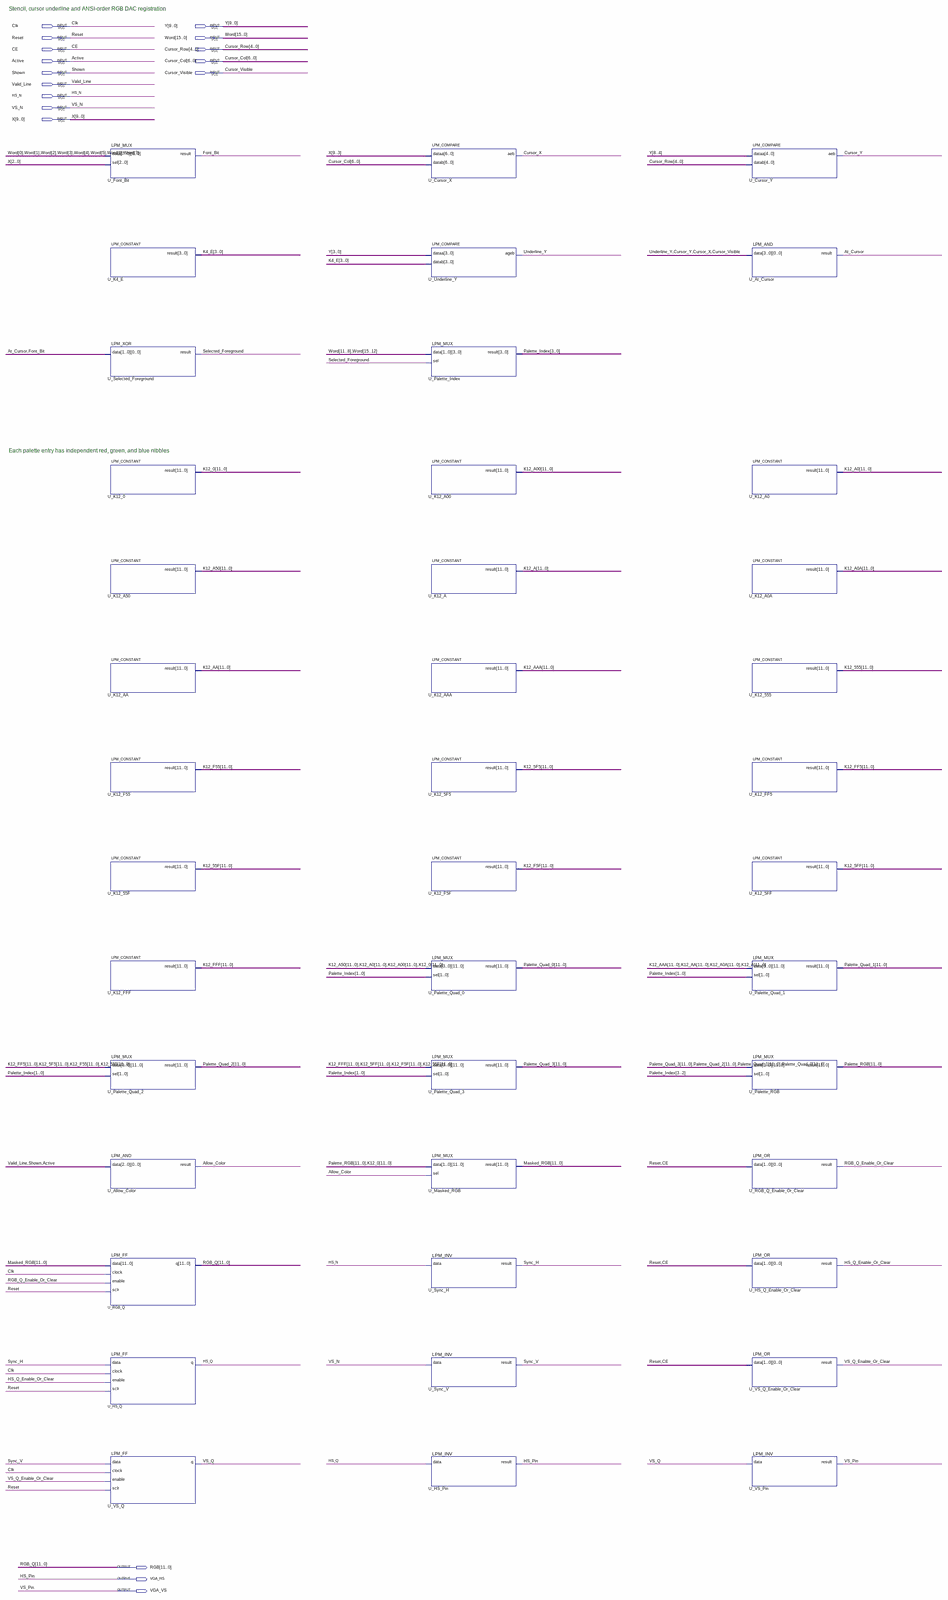
[diagram p0: schematic sheet, whole]
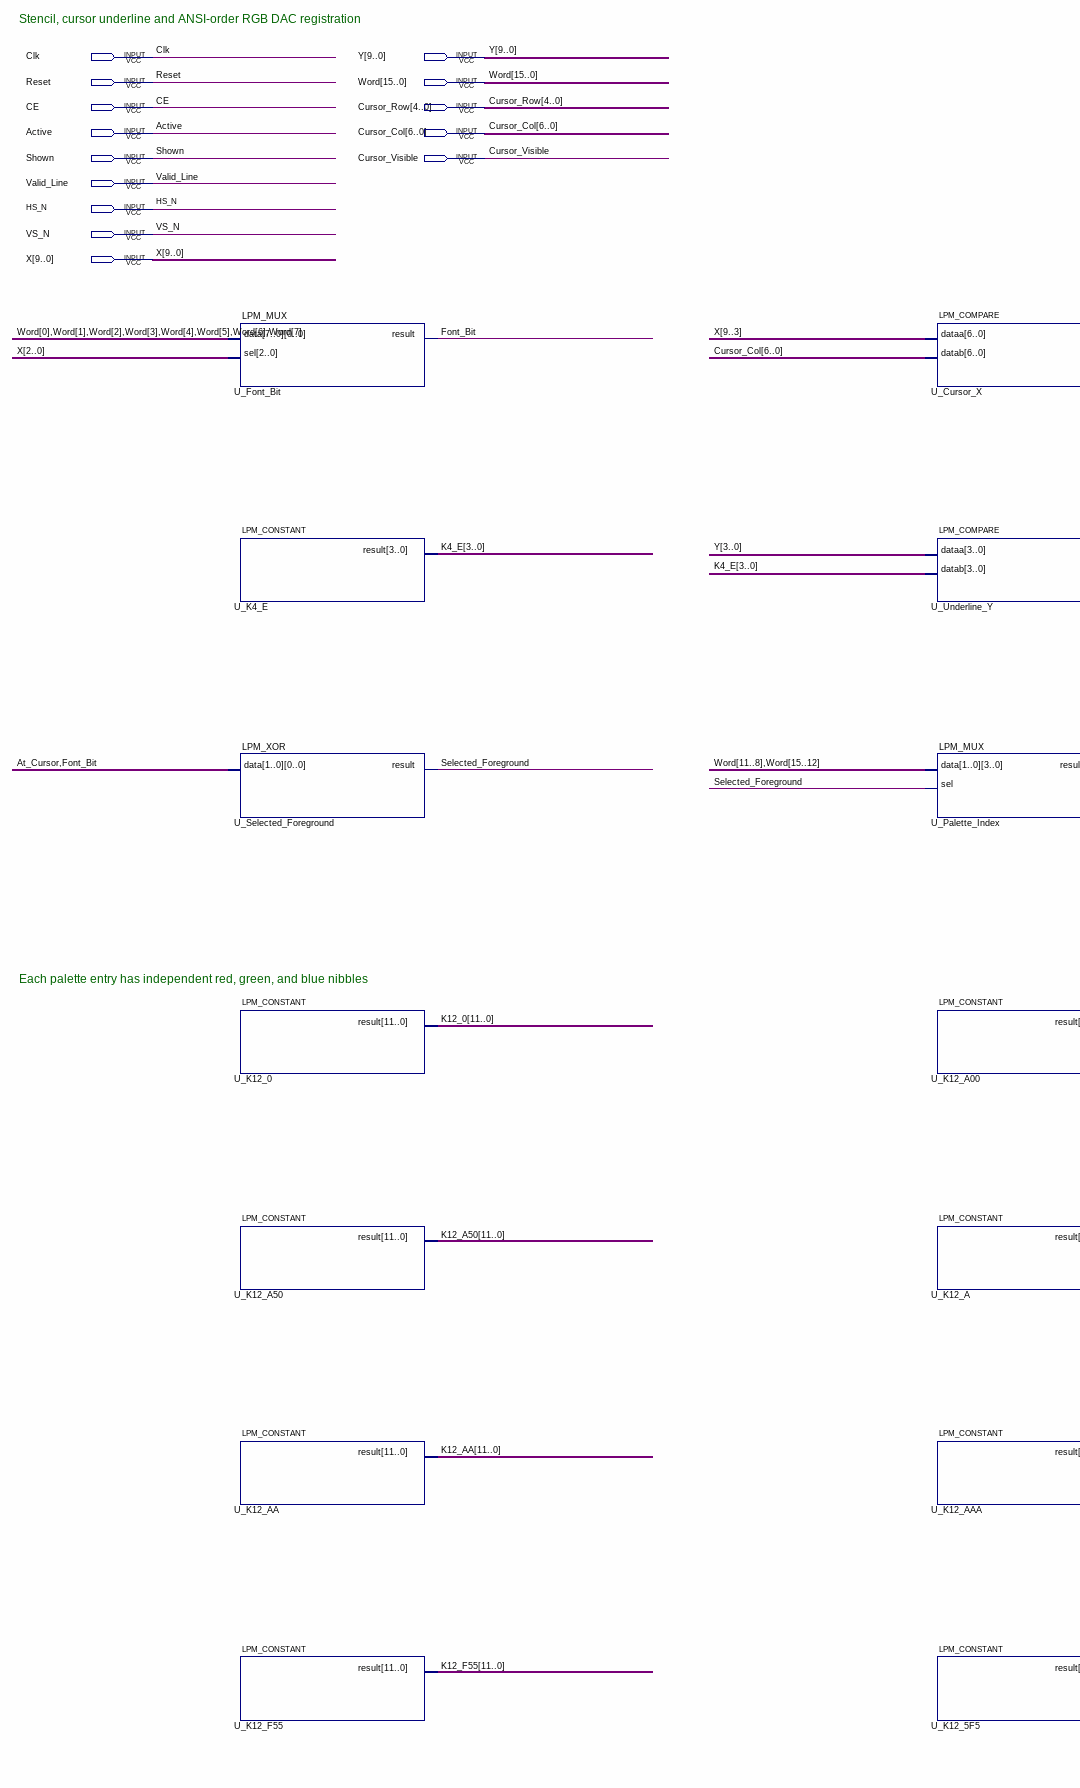
[diagram p1: schematic sheet, upper left part]
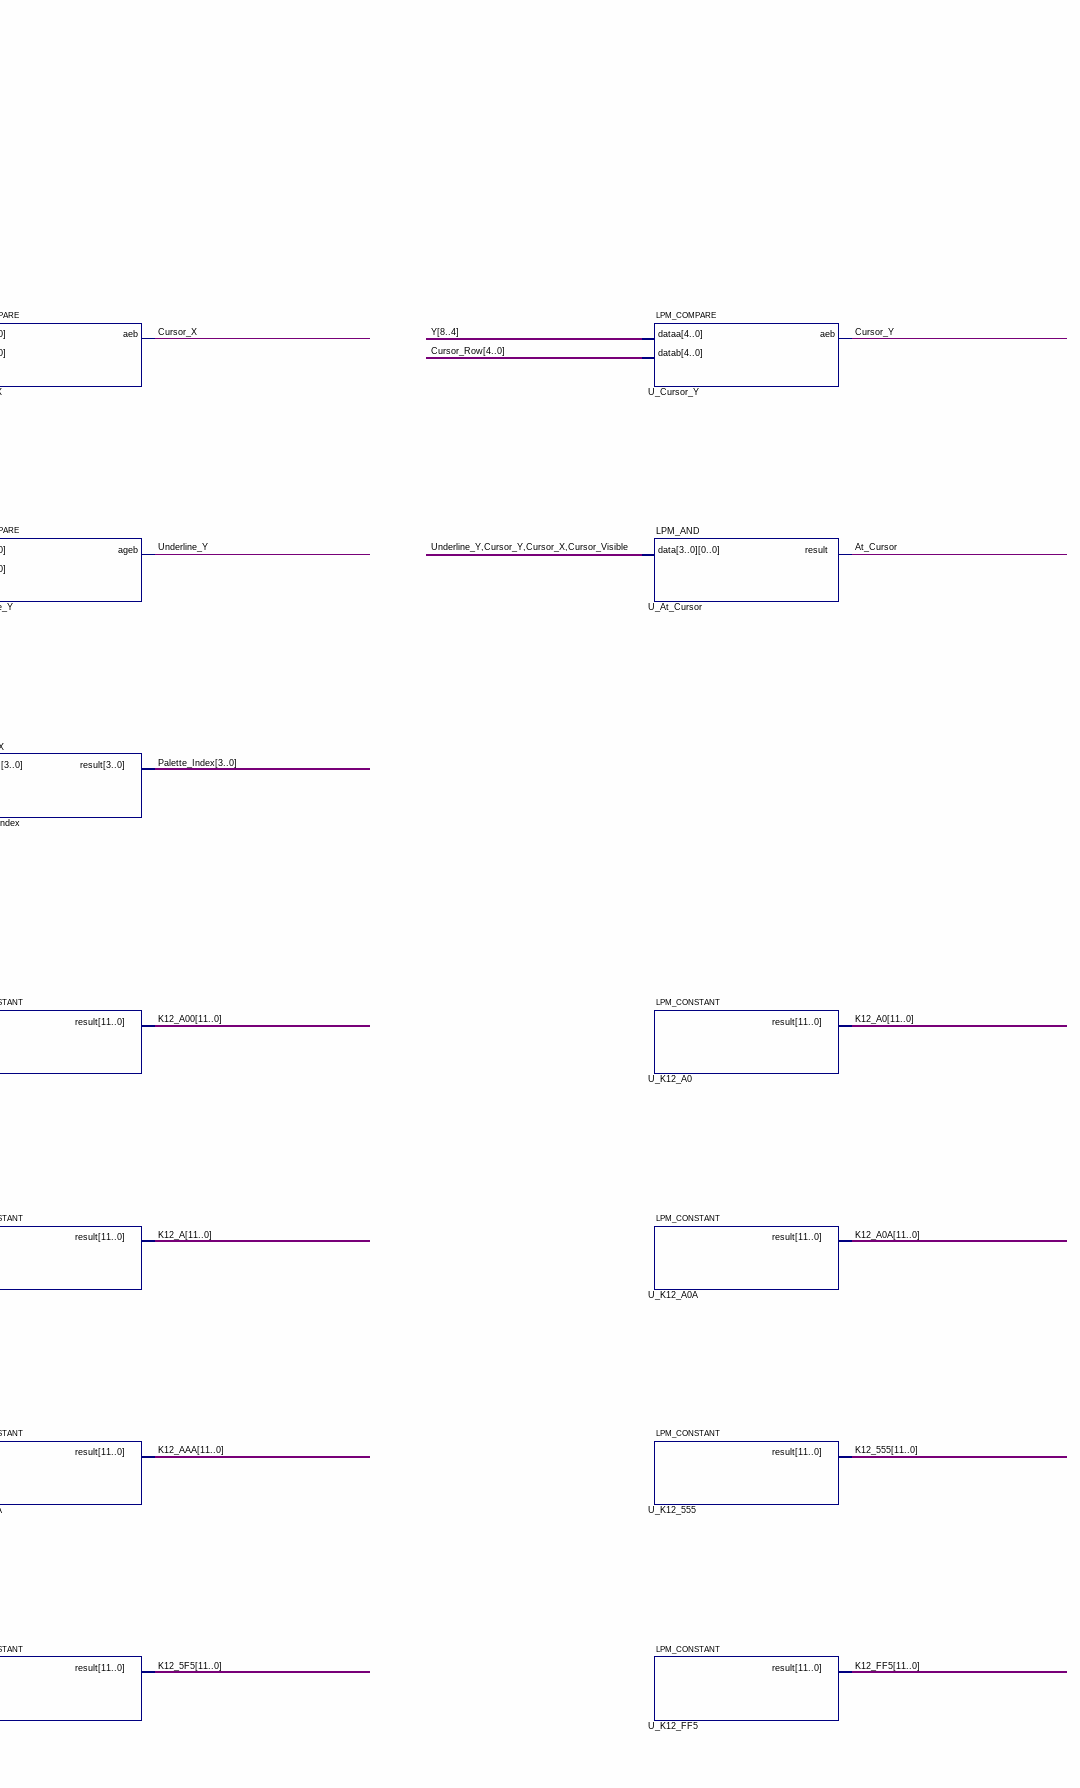
[diagram p2: schematic sheet, upper right part]
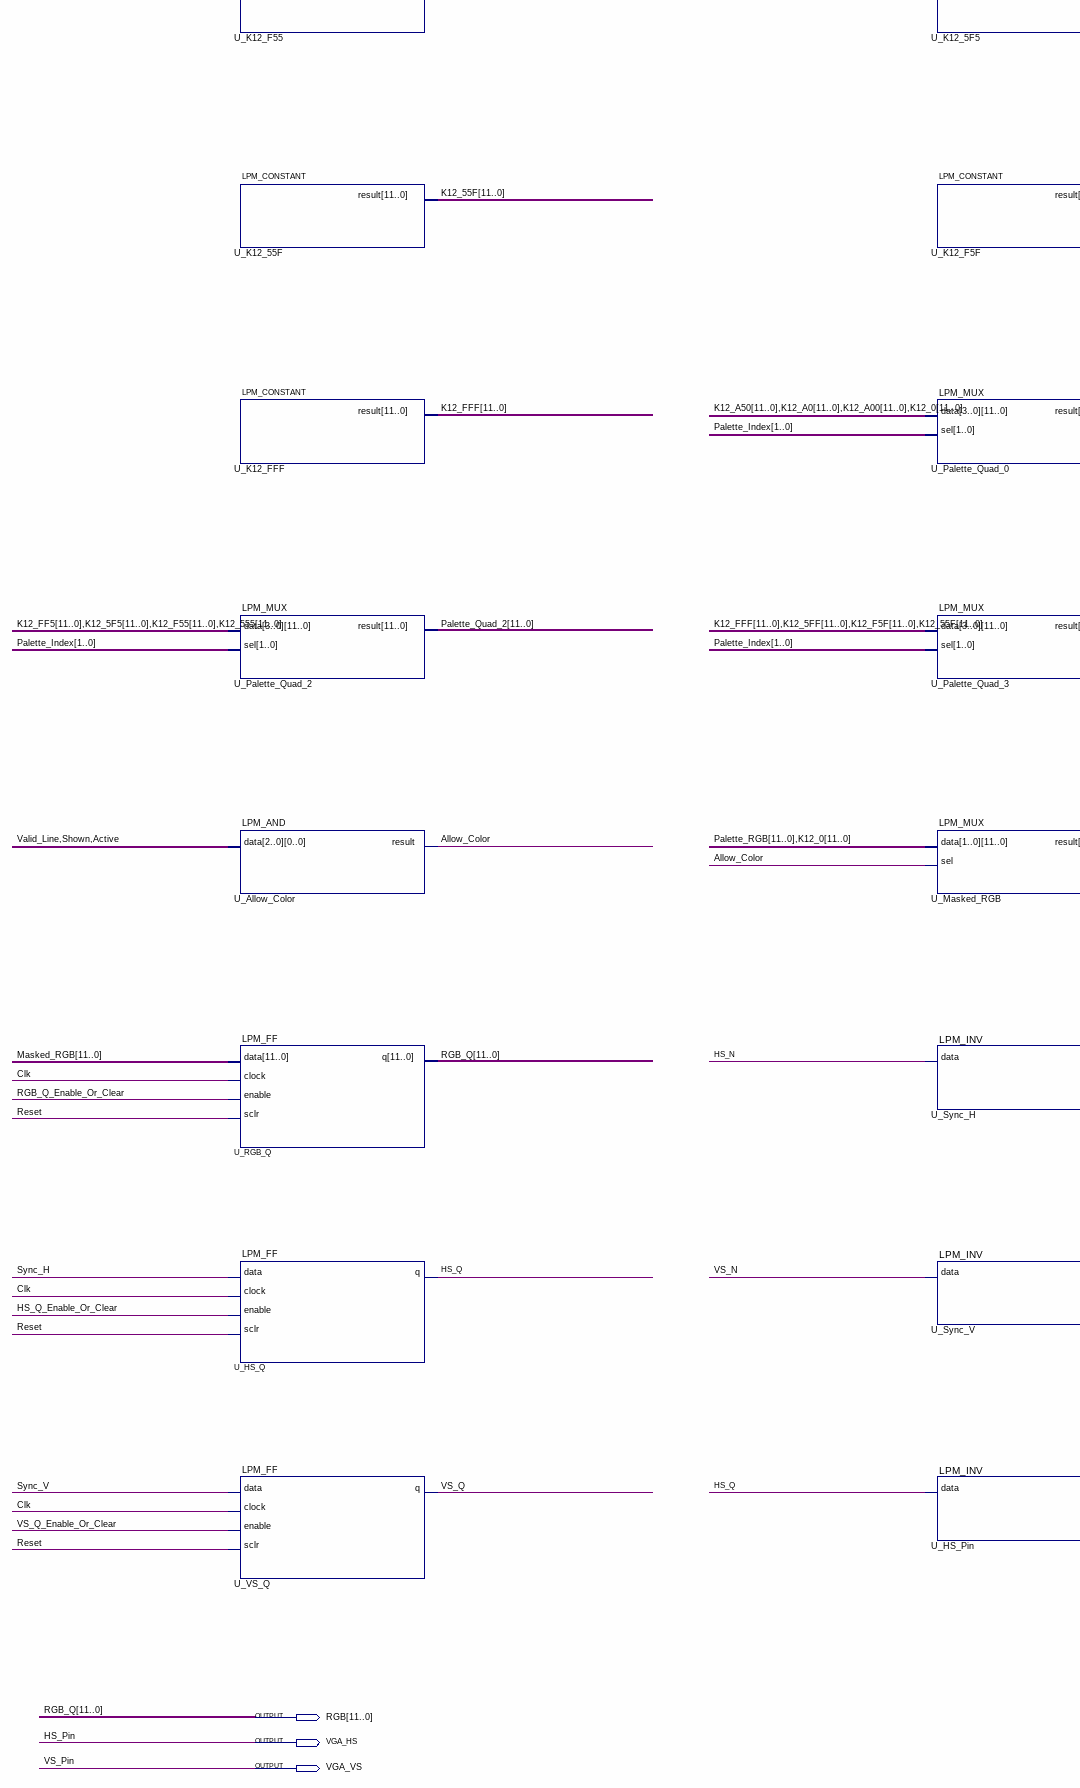
[diagram p3: schematic sheet, lower left part]
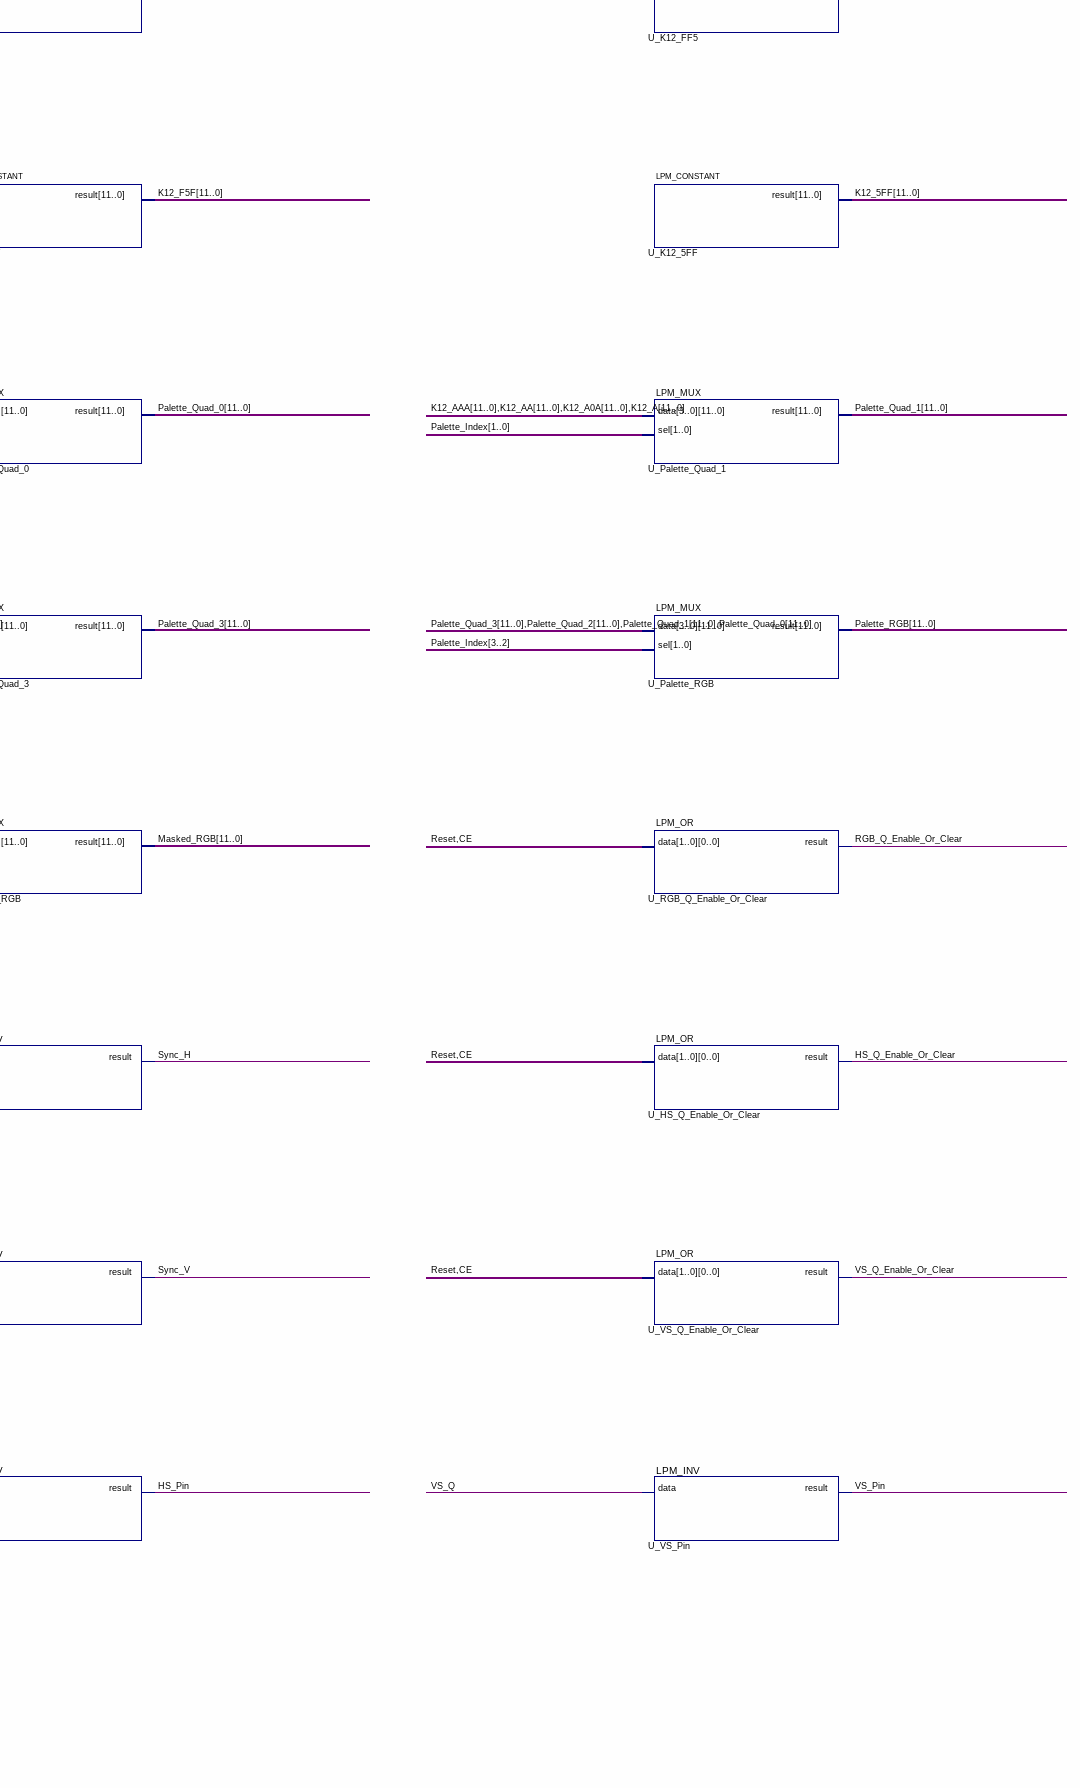
[diagram p4: schematic sheet, lower right part]
// Quartus schematic Pixel_Output.bdf as structural Verilog: 41 symbols, 17 pins
module Pixel_Output (
  input  Clk,
  input  [9:0] Y,
  input  Reset,
  input  [15:0] Word,
  input  CE,
  input  [4:0] Cursor_Row,
  input  Active,
  input  [6:0] Cursor_Col,
  input  Shown,
  input  Cursor_Visible,
  input  Valid_Line,
  input  HS_N,
  input  VS_N,
  input  [9:0] X,
  output [11:0] RGB,
  output VGA_HS,
  output VGA_VS
);

  wire Allow_Color, At_Cursor, Cursor_X, Cursor_Y, Font_Bit, HS_Q, HS_Q_Enable_Or_Clear,
       RGB_Q_Enable_Or_Clear, Selected_Foreground, Sync_H, Sync_V, Underline_Y, VS_Q, VS_Q_Enable_Or_Clear;
  wire [3:0] K4_E, Palette_Index;
  wire [11:0] K12_0, K12_5F5, K12_5FF, K12_55F, K12_555, K12_A, K12_A00, K12_A0, K12_A0A, K12_A50, K12_AA,
       K12_AAA, K12_F5F, K12_F55, K12_FF5, K12_FFF, Masked_RGB, Palette_Quad_0, Palette_Quad_1,
       Palette_Quad_2, Palette_Quad_3, Palette_RGB;

  LPM_MUX #(.LPM_WIDTH(1), .LPM_SIZE(8), .LPM_WIDTHS(3)) U_Font_Bit (
    .data({Word[0], Word[1], Word[2], Word[3], Word[4], Word[5], Word[6], Word[7]}), .sel(X[2:0]),
    .result(Font_Bit));
  LPM_CONSTANT #(.LPM_WIDTH(4), .LPM_CVALUE(14)) U_K4_E (.result(K4_E));
  LPM_XOR #(.LPM_WIDTH(1), .LPM_SIZE(2)) U_Selected_Foreground (
    .data({At_Cursor, Font_Bit}), .result(Selected_Foreground));
  LPM_CONSTANT #(.LPM_WIDTH(12), .LPM_CVALUE(0)) U_K12_0 (.result(K12_0));
  LPM_CONSTANT #(.LPM_WIDTH(12), .LPM_CVALUE(2640)) U_K12_A50 (.result(K12_A50));
  LPM_CONSTANT #(.LPM_WIDTH(12), .LPM_CVALUE(170)) U_K12_AA (.result(K12_AA));
  LPM_CONSTANT #(.LPM_WIDTH(12), .LPM_CVALUE(3925)) U_K12_F55 (.result(K12_F55));
  LPM_CONSTANT #(.LPM_WIDTH(12), .LPM_CVALUE(1375)) U_K12_55F (.result(K12_55F));
  LPM_CONSTANT #(.LPM_WIDTH(12), .LPM_CVALUE(4095)) U_K12_FFF (.result(K12_FFF));
  LPM_MUX #(.LPM_WIDTH(12), .LPM_SIZE(4), .LPM_WIDTHS(2)) U_Palette_Quad_2 (
    .data({K12_FF5, K12_5F5, K12_F55, K12_555}), .sel(Palette_Index[1:0]), .result(Palette_Quad_2));
  LPM_AND #(.LPM_WIDTH(1), .LPM_SIZE(3)) U_Allow_Color (.data({Valid_Line, Shown, Active}), .result(Allow_Color));
  LPM_FF #(.LPM_WIDTH(12), .LPM_FFTYPE("DFF")) U_RGB_Q (
    .data(Masked_RGB), .clock(Clk), .enable(RGB_Q_Enable_Or_Clear), .sclr(Reset), .q(RGB));
  LPM_FF #(.LPM_WIDTH(1), .LPM_FFTYPE("DFF")) U_HS_Q (
    .data(Sync_H), .clock(Clk), .enable(HS_Q_Enable_Or_Clear), .sclr(Reset), .q(HS_Q));
  LPM_FF #(.LPM_WIDTH(1), .LPM_FFTYPE("DFF")) U_VS_Q (
    .data(Sync_V), .clock(Clk), .enable(VS_Q_Enable_Or_Clear), .sclr(Reset), .q(VS_Q));
  LPM_COMPARE #(.LPM_WIDTH(7), .LPM_REPRESENTATION("UNSIGNED")) U_Cursor_X (
    .dataa(X[9:3]), .datab(Cursor_Col), .aeb(Cursor_X));
  LPM_COMPARE #(.LPM_WIDTH(4), .LPM_REPRESENTATION("UNSIGNED")) U_Underline_Y (
    .dataa(Y[3:0]), .datab(K4_E), .ageb(Underline_Y));
  LPM_MUX #(.LPM_WIDTH(4), .LPM_SIZE(2), .LPM_WIDTHS(1)) U_Palette_Index (
    .data({Word[11:8], Word[15:12]}), .sel(Selected_Foreground), .result(Palette_Index));
  LPM_CONSTANT #(.LPM_WIDTH(12), .LPM_CVALUE(2560)) U_K12_A00 (.result(K12_A00));
  LPM_CONSTANT #(.LPM_WIDTH(12), .LPM_CVALUE(10)) U_K12_A (.result(K12_A));
  LPM_CONSTANT #(.LPM_WIDTH(12), .LPM_CVALUE(2730)) U_K12_AAA (.result(K12_AAA));
  LPM_CONSTANT #(.LPM_WIDTH(12), .LPM_CVALUE(1525)) U_K12_5F5 (.result(K12_5F5));
  LPM_CONSTANT #(.LPM_WIDTH(12), .LPM_CVALUE(3935)) U_K12_F5F (.result(K12_F5F));
  LPM_MUX #(.LPM_WIDTH(12), .LPM_SIZE(4), .LPM_WIDTHS(2)) U_Palette_Quad_0 (
    .data({K12_A50, K12_A0, K12_A00, K12_0}), .sel(Palette_Index[1:0]), .result(Palette_Quad_0));
  LPM_MUX #(.LPM_WIDTH(12), .LPM_SIZE(4), .LPM_WIDTHS(2)) U_Palette_Quad_3 (
    .data({K12_FFF, K12_5FF, K12_F5F, K12_55F}), .sel(Palette_Index[1:0]), .result(Palette_Quad_3));
  LPM_MUX #(.LPM_WIDTH(12), .LPM_SIZE(2), .LPM_WIDTHS(1)) U_Masked_RGB (
    .data({Palette_RGB, K12_0}), .sel(Allow_Color), .result(Masked_RGB));
  LPM_INV #(.LPM_WIDTH(1)) U_Sync_H (.data(HS_N), .result(Sync_H));
  LPM_INV #(.LPM_WIDTH(1)) U_Sync_V (.data(VS_N), .result(Sync_V));
  LPM_INV #(.LPM_WIDTH(1)) U_HS_Pin (.data(HS_Q), .result(VGA_HS));
  LPM_COMPARE #(.LPM_WIDTH(5), .LPM_REPRESENTATION("UNSIGNED")) U_Cursor_Y (
    .dataa(Y[8:4]), .datab(Cursor_Row), .aeb(Cursor_Y));
  LPM_AND #(.LPM_WIDTH(1), .LPM_SIZE(4)) U_At_Cursor (
    .data({Underline_Y, Cursor_Y, Cursor_X, Cursor_Visible}), .result(At_Cursor));
  LPM_CONSTANT #(.LPM_WIDTH(12), .LPM_CVALUE(160)) U_K12_A0 (.result(K12_A0));
  LPM_CONSTANT #(.LPM_WIDTH(12), .LPM_CVALUE(2570)) U_K12_A0A (.result(K12_A0A));
  LPM_CONSTANT #(.LPM_WIDTH(12), .LPM_CVALUE(1365)) U_K12_555 (.result(K12_555));
  LPM_CONSTANT #(.LPM_WIDTH(12), .LPM_CVALUE(4085)) U_K12_FF5 (.result(K12_FF5));
  LPM_CONSTANT #(.LPM_WIDTH(12), .LPM_CVALUE(1535)) U_K12_5FF (.result(K12_5FF));
  LPM_MUX #(.LPM_WIDTH(12), .LPM_SIZE(4), .LPM_WIDTHS(2)) U_Palette_Quad_1 (
    .data({K12_AAA, K12_AA, K12_A0A, K12_A}), .sel(Palette_Index[1:0]), .result(Palette_Quad_1));
  LPM_MUX #(.LPM_WIDTH(12), .LPM_SIZE(4), .LPM_WIDTHS(2)) U_Palette_RGB (
    .data({Palette_Quad_3, Palette_Quad_2, Palette_Quad_1, Palette_Quad_0}), .sel(Palette_Index[3:2]),
    .result(Palette_RGB));
  LPM_OR #(.LPM_WIDTH(1), .LPM_SIZE(2)) U_RGB_Q_Enable_Or_Clear (.data({Reset, CE}), .result(RGB_Q_Enable_Or_Clear));
  LPM_OR #(.LPM_WIDTH(1), .LPM_SIZE(2)) U_HS_Q_Enable_Or_Clear (.data({Reset, CE}), .result(HS_Q_Enable_Or_Clear));
  LPM_OR #(.LPM_WIDTH(1), .LPM_SIZE(2)) U_VS_Q_Enable_Or_Clear (.data({Reset, CE}), .result(VS_Q_Enable_Or_Clear));
  LPM_INV #(.LPM_WIDTH(1)) U_VS_Pin (.data(VS_Q), .result(VGA_VS));

  // Other names for the same wires on the sheet: HS_Pin = VGA_HS; RGB_Q[11:0] = RGB; VS_Pin = VGA_VS

  // Notes on the sheet:
  //   Stencil, cursor underline and ANSI-order RGB DAC registration
  //   Each palette entry has independent red, green, and blue nibbles
endmodule
